# EasyEDA Pro project ProPrj_天猛星电赛扩展板_2026-07-18.epro

# Schematic Schematic1
Board Name: Board1; Create Date: 2026-06-12; Page Name: P1; Project Name: 天猛星电赛扩展板; Schematic Name: Schematic1; Update Date: 2026-07-17; Company: 遇到困难睡大觉zxz; Page Size: A4; Version: V1.0
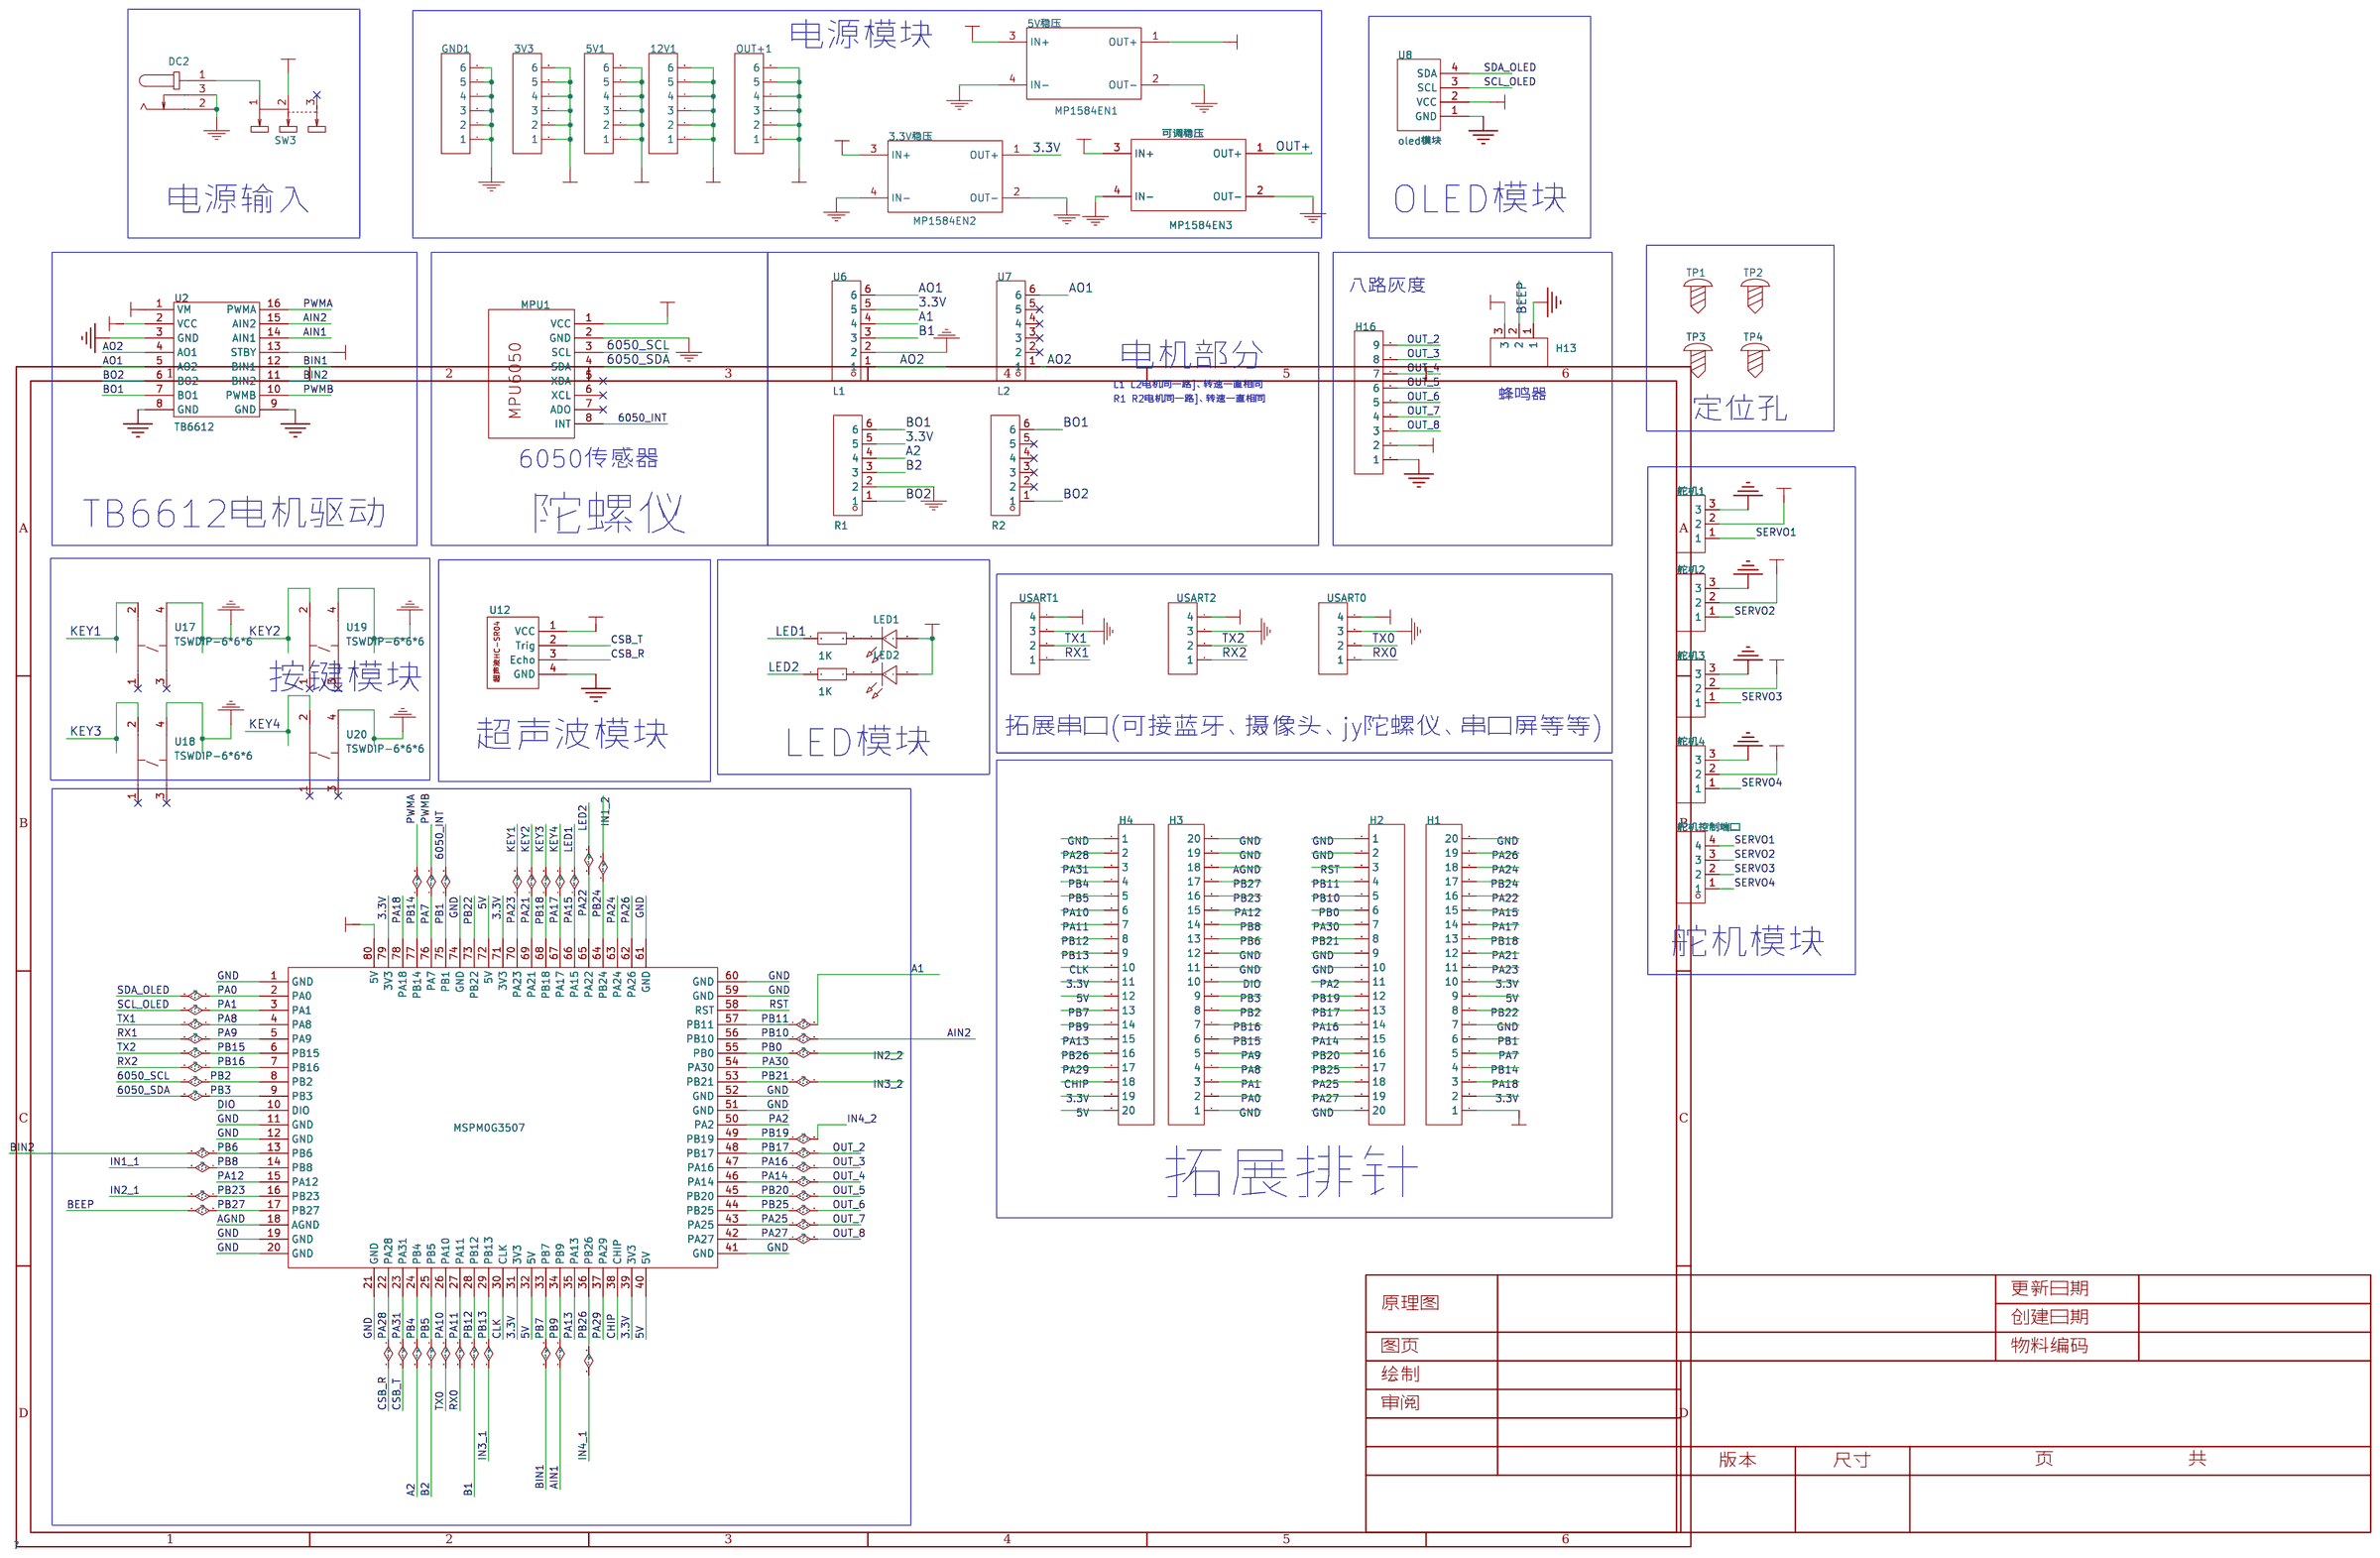
[diagram p0: schematic sheet]

## Parts
3.3V稳压  MP1584EN2  [MP1584EN]
3V3  HDR-M-2.54_1x6  [HDR-M-2.54_1X6]
5V1  HDR-M-2.54_1x6  [HDR-M-2.54_1X6]
5V稳压  MP1584EN1  [MP1584EN]
12V1  HDR-M-2.54_1x6  [HDR-M-2.54_1X6]
DC2  DC005-T  [DC-IN-TH_DC005-T]
GND1  HDR-M-2.54_1x6  [HDR-M-2.54_1X6]
H1  -  [HDR-TH_20P-P2.54-V-F]
H2  -  [HDR-TH_20P-P2.54-V-F]
H3  -  [HDR-TH_20P-P2.54-V-F]
H4  -  [HDR-TH_20P-P2.54-V-F]
H13  -  [HDR-TH_3P-P2.54-V-F]
H16  -  [HDR-TH_9P-P2.54-V-F-1]
LED1  LED-TH-5mm_R  [LED-TH_BD5.0_RED]
LED2  LED-TH-5mm_R  [LED-TH_BD5.0_RED]
MPU1  MPU6050 有孔(锁定丝印)  [MPU6050-丝印不可移]
MSPM0G3507  -  [嘉立创天猛星]
OUT+1  HDR-M-2.54_1x6  [HDR-M-2.54_1X6]
R7  1K  [R_AXIAL-0.3]
R11  1K  [R_AXIAL-0.3]
SW3  SS-12D10L5  [SW-TH_SS-12D10L5]
TP1  M3铜柱带丝印  [M3铜柱]
TP2  M3铜柱带丝印  [M3铜柱]
TP3  M3铜柱带丝印  [M3铜柱]
TP4  M3铜柱带丝印  [M3铜柱]
U2  TB6612  [TB6612模块]
U6  L1  [CONN-TH_6P-P2.50_ZX-XH2.54-6PWZ]
U7  L2  [CONN-TH_6P-P2.50_ZX-XH2.54-6PWZ]
U8  oled模块  [OLED模块]
U9  R2  [CONN-TH_6P-P2.50_ZX-XH2.54-6PWZ]
U12  -  [超声波模块]
U16  R1  [CONN-TH_6P-P2.50_ZX-XH2.54-6PWZ]
U17  TSWDIP-6*6*6  [KEY-TH_4P-L6.0-W6.0-P4.50-LS6.50]
U18  TSWDIP-6*6*6  [KEY-TH_4P-L6.0-W6.0-P4.50-LS6.50]
U19  TSWDIP-6*6*6  [KEY-TH_4P-L6.0-W6.0-P4.50-LS6.50]
U20  TSWDIP-6*6*6  [KEY-TH_4P-L6.0-W6.0-P4.50-LS6.50]
USART0  HDR-M-2.54_1x4  [HDR-M-2.54_1X4]
USART1  HDR-M-2.54_1x4  [HDR-M-2.54_1X4]
USART2  HDR-M-2.54_1x4  [HDR-M-2.54_1X4]
可调稳压  MP1584EN3  [MP1584EN]
舵机1  -  [HDR-TH_3P-P2.54-V-F]
舵机2  -  [HDR-TH_3P-P2.54-V-F]
舵机3  -  [HDR-TH_3P-P2.54-V-F]
舵机4  -  [HDR-TH_3P-P2.54-V-F]
舵机控制端口  -  [HDR-TH_4P-P2.54-V-M]

## Library data of the parts
3.3V稳压 5V稳压 可调稳压 = MP1584EN_DC TO DC成品板: Check: false
3V3 5V1 12V1 GND1 OUT+1 = HDR-M-2.54_1x6: Supplier Part: C190819; Supplier: LCSC; Check: false
DC2 = DC005-T: 连接器类型:DC电源插座;安装方式:弯插;触点内径:2mm;触点外径:6.3mm;额定电流:500mA;额定电压:30V;工作温度范围:-25℃~+70℃;; LCSC Part Name: DC电源插座 内径:2mm 外径:6.3mm; Supplier Part: C431532; Manufacturer: SHOU HAN(首韩); Supplier Footprint: 插件; JLCPCB Part Class: Extended Part; Datasheet: https://atta.szlcsc.com/upload/public/pdf/source/20190925/C431532_27AF2D37554BC0900100E1656035C16A.pdf; Supplier: LCSC; Connector Type: DC电源插座; Mounting Style: 弯插; Inside Contact Diameter: 2mm; Outside Contact Diameter: 6.3mm; Current Rating (Max): 500mA; Voltage Rating (Max): 30V; Operating Temperature Range: -25℃~+70℃; Check: false
H1-H4 = HDR-F_2.54_1x20P: Supplier Part: C50984; Supplier Footprint: 插件; Check: false
H13 舵机1-舵机4 = HDR-F_2.54_1x3P: Supplier Part: C541850; Supplier Footprint: 插件; Check: false
H16 = HDR-F_2.54_1x9P: Supplier Part: C39576; Supplier Footprint: 插件
LED1 LED2 = LED-TH-5mm_R: Manufacturer: EVERLIGHT(台湾亿光); Manufacturer Part: 333-2SURD/S530-A3; Supplier Part: C87271; Supplier: LCSC; Check: false
MPU1 = MPU6050 有孔(锁定丝印): Check: false
MSPM0G3507 = 立创天猛星-MSPM0G3507: Check: false
R7 R11 = Res_0603: Supplier Footprint: 0603; Check: false
SW3 = SS-12D10L5: 电路结构:单刀双掷;安装方式:直插;开关颜色:黑色;额定电流(DC):3A;额定电压(DC):125V;额定电流(AC):3A;额定电压(AC):125V;机械寿命:1万次;; LCSC Part Name: 柄长5mm 直插双档 滑动开关; Supplier Part: C319012; Manufacturer: XKB Connectivity(中国星坤); Supplier Footprint: 插件; JLCPCB Part Class: Extended Part; Datasheet: https://atta.szlcsc.com/upload/public/pdf/source/20211009/D6412F37AABE6F9459A6EE7FA4DAEADB.pdf; Supplier: LCSC; Circuit: 单刀双掷; Actuator Style: 矩形柱状; Pin Style: PC引脚; Switch Length: 13mm; Switch Width: 6.8mm; Switch Height: 6.4mm; Mounting Style: 直插; Actuator Color: 黑色; Current Rating (DC): 3A; Voltage Rating (DC): 125V; Current Rating (AC): 3A; Voltage Rating (AC): 125V; Mechanical Life: 1万次; Operating Temperature: -40℃~+85℃; Check: false
TP1-TP4 = M3铜柱带丝印: Check: false
U2 = TB6612模块: Check: false
U6 U7 U9 U16 = ZX-XH2.54-6PWZ: 插针结构:1x6P;间距:2.5mm;安装方式:弯插;参考系列:XH;总PIN数:6P;排数:1;每排PIN数:6;行距:-;额定电流:3A;触头材质:黄铜;触头镀层:锡;工作温度范围:-25℃~+85℃;; LCSC Part Name: 1x6P 间距:2.5mm 弯插 系列:XH; Supplier Part: C7429645; Manufacturer: Megastar(兆星); Supplier Footprint: 弯插,P=2.5mm; JLCPCB Part Class: 扩展库; Datasheet: https://atta.szlcsc.com/upload/public/pdf/source/20230619/9057EB94260093B1525D11E652DE2D7A.pdf; Supplier: LCSC; Pins Structure: 1x6P; Pitch: 2.5mm; Mounting Type: 弯插; Reference Series: XH; Number of Pins: 6P; Number of Rows: 1; Number of PINs Per Row: 6; Rated Current: 3A; Contact Material: 黄铜; Contact Plating: 锡; Operating Temperature: -25℃~+85℃; Rated Voltage (Max): 250V; Plastic Material: PA66; Flame Retardant Rating: UL94V-0; Color: 白色; Z-Height of the Board: 5.9mm; X-Length of Bottom Edge on Board (Spacing Line): 17.5mm; Y-Width of Bottom Edge on Board: 7.32mm; Check: false
U8 = oled模块: Check: false
U12 = 超声波模块: _: 3; Check: false
U17-U20 = TSWDIP-6*6*6: Supplier Part: C9900020134; JLCPCB Part Class: 扩展库; Supplier: LCSC
USART0-USART2 = HDR-M-2.54_1x4: Supplier Part: C124378; Supplier: LCSC; Check: false
舵机控制端口 = HDR-M_2.54_1x4P: Supplier Part: C492403; Supplier Footprint: 插件; Check: false

## Nets
3.3V: 3.3V稳压.1(OUT+) 3V3.1 3V3.2 3V3.3 3V3.4 3V3.5 3V3.6 H1.2 H1.10 H4.11 H4.19 H13.3 MSPM0G3507.31(3V3) MSPM0G3507.39(3V3) MSPM0G3507.71(3V3) MSPM0G3507.79(3V3) U6.5 U16.5
5V: 5V1.1 5V1.2 5V1.3 5V1.4 5V1.5 5V1.6 5V稳压.1(OUT+) H1.1 H1.9 H4.12 H4.20 H16.2 LED1.1 LED2.1 MPU1.1(VCC) MSPM0G3507.32(5V) MSPM0G3507.40(5V) MSPM0G3507.72(5V) MSPM0G3507.80(5V) U2.2(VCC) U2.13(STBY) U8.2(VCC) U12.1(VCC) USART0.4 USART1.4 USART2.4
AGND: H3.18 MSPM0G3507.18(AGND)
GND: 3.3V稳压.2(OUT-) 3.3V稳压.4(IN-) 5V稳压.2(OUT-) 5V稳压.4(IN-) DC2.2 DC2.3 GND1.1 GND1.2 GND1.3 GND1.4 GND1.5 GND1.6 H1.7 H1.20 H2.1 H2.2 H2.9 H2.10 H2.20 H3.1 H3.11 H3.12 H3.19 H3.20 H4.1 H13.1 H16.1 MPU1.2(GND) MSPM0G3507.1(GND) MSPM0G3507.11(GND) MSPM0G3507.12(GND) MSPM0G3507.19(GND) MSPM0G3507.20(GND) MSPM0G3507.21(GND) MSPM0G3507.41(GND) MSPM0G3507.51(GND) MSPM0G3507.52(GND) MSPM0G3507.59(GND) MSPM0G3507.60(GND) MSPM0G3507.61(GND) MSPM0G3507.74(GND) U2.3(GND) U2.8(GND) U2.9(GND) U6.2 U8.1(GND) U12.4(GND) U16.2 U17.4 U18.4 U19.4 U20.4 USART0.3 USART1.3 USART2.3 可调稳压.2(OUT-) 可调稳压.4(IN-) 舵机1.3 舵机2.3 舵机3.3 舵机4.3
VBAT_IN: 3.3V稳压.3(IN+) 5V稳压.3(IN+) 12V1.1 12V1.2 12V1.3 12V1.4 12V1.5 12V1.6 SW3.2 U2.1(VM) 可调稳压.3(IN+)
6050_INT: H1.6 MPU1.8(INT) MSPM0G3507.75(PB1)
6050_SCL: H3.8 MPU1.3(SCL) MSPM0G3507.8(PB2)
6050_SDA: H3.9 MPU1.4(SDA) MSPM0G3507.9(PB3)
A1: H2.4 MSPM0G3507.57(PB11) U6.4
A2: H4.4 MSPM0G3507.24(PB4) U16.4
AIN1: H4.14 MSPM0G3507.34(PB9) U2.14(AIN1)
AIN2: H2.5 MSPM0G3507.56(PB10) U2.15(AIN2)
AO1: U2.5(AO2) U6.6 U7.6
AO2: U2.4(AO1) U6.1 U7.1
B1: H4.8 MSPM0G3507.28(PB12) U6.3
B2: H4.5 MSPM0G3507.25(PB5) U16.3
BEEP: H3.17 H13.2 MSPM0G3507.17(PB27)
BIN1: H4.13 MSPM0G3507.33(PB7) U2.12(BIN1)
BIN2: H3.13 MSPM0G3507.13(PB6) U2.11(BIN2)
BO1: U2.7(BO1) U9.6 U16.6
BO2: U2.6(BO2) U9.1 U16.1
CHIP: H4.18 MSPM0G3507.38(CHIP)
CLK: H4.10 MSPM0G3507.30(CLK)
CSB_R: H4.2 MSPM0G3507.22(PA28) U12.3(Echo)
CSB_T: H4.3 MSPM0G3507.23(PA31) U12.2(Trig)
DIO: H3.10 MSPM0G3507.10(DIO)
IN1_1: H3.14 MSPM0G3507.14(PB8)
IN1_2: H1.17 MSPM0G3507.64(PB24)
IN2_1: H3.16 MSPM0G3507.16(PB23)
IN2_2: H2.6 MSPM0G3507.55(PB0)
IN3_1: H4.9 MSPM0G3507.29(PB13)
IN3_2: H2.8 MSPM0G3507.53(PB21)
IN4_1: H4.16 MSPM0G3507.36(PB26)
IN4_2: H2.12 MSPM0G3507.49(PB19)
KEY1: H1.11 MSPM0G3507.70(PA23) U17.2
KEY2: H1.12 MSPM0G3507.69(PA21) U19.2
KEY3: H1.13 MSPM0G3507.68(PB18) U18.2
KEY4: H1.14 MSPM0G3507.67(PA17) U20.2
LED1: H1.15 MSPM0G3507.66(PA15) R7.1
LED2: H1.16 MSPM0G3507.65(PA22) R11.1
OUT+: OUT+1.1 OUT+1.2 OUT+1.3 OUT+1.4 OUT+1.5 OUT+1.6 可调稳压.1(OUT+) 舵机1.2 舵机2.2 舵机3.2 舵机4.2
OUT_2: H2.13 H16.9 MSPM0G3507.48(PB17)
OUT_3: H2.14 H16.8 MSPM0G3507.47(PA16)
OUT_4: H2.15 H16.7 MSPM0G3507.46(PA14)
OUT_5: H2.16 H16.6 MSPM0G3507.45(PB20)
OUT_6: H2.17 H16.5 MSPM0G3507.44(PB25)
OUT_7: H2.18 H16.4 MSPM0G3507.43(PA25)
OUT_8: H2.19 H16.3 MSPM0G3507.42(PA27)
PA0: H3.2 MSPM0G3507.2(PA0) U8.4(SDA)
PA1: H3.3 MSPM0G3507.3(PA1) U8.3(SCL)
PA2: H2.11 MSPM0G3507.50(PA2)
PA7: H1.5 MSPM0G3507.76(PA7) U2.10(PWMB)
PA8: H3.4 MSPM0G3507.4(PA8) USART1.2
PA9: H3.5 MSPM0G3507.5(PA9) USART1.1
PA10: H4.6 MSPM0G3507.26(PA10) USART0.2
PA11: H4.7 MSPM0G3507.27(PA11) USART0.1
PA12: H3.15 MSPM0G3507.15(PA12)
PA13: H4.15 MSPM0G3507.35(PA13)
PA18: H1.3 MSPM0G3507.78(PA18)
PA24: H1.18 MSPM0G3507.63(PA24)
PA26: H1.19 MSPM0G3507.62(PA26)
PA29: H4.17 MSPM0G3507.37(PA29)
PA30: H2.7 MSPM0G3507.54(PA30)
PB14: H1.4 MSPM0G3507.77(PB14) U2.16(PWMA)
PB15: H3.6 MSPM0G3507.6(PB15) USART2.2
PB16: H3.7 MSPM0G3507.7(PB16) USART2.1
PB22: H1.8 MSPM0G3507.73(PB22)
RST: H2.3 MSPM0G3507.58(RST)
SERVO1: 舵机1.1 舵机控制端口.4
SERVO2: 舵机2.1 舵机控制端口.3
SERVO3: 舵机3.1 舵机控制端口.2
SERVO4: 舵机4.1 舵机控制端口.1
$1N12722: DC2.1 SW3.1
$1N16587: LED1.2 R7.2
$1N16619: LED2.2 R11.2

Not connected (* = marked no-connect by the designer): MPU1 5(XDA)* 6(XCL)* 7(ADO)*; SW3 3*; U7 2* 3* 4* 5*; U9 2* 3* 4* 5*; U17 1* 3*; U18 1* 3*; U19 1* 3*; U20 1* 3*

## Notes on the sheet
- 电源模块
- 电源输入
- OLED模块
- 八路灰度
- 电机部分
- L1 L2电机同一路]、转速一直相同
- R1 R2电机同一路]、转速一直相同
- 蜂鸣器
- 定位孔
- 6050传感器
- TB6612电机驱动
- 陀螺仪
- 按键模块
- 拓展串口(可接蓝牙、摄像头、jy陀螺仪、串口屏等等)
- 超声波模块
- LED模块
- 舵机模块
- 拓展排针

# Board PCB6
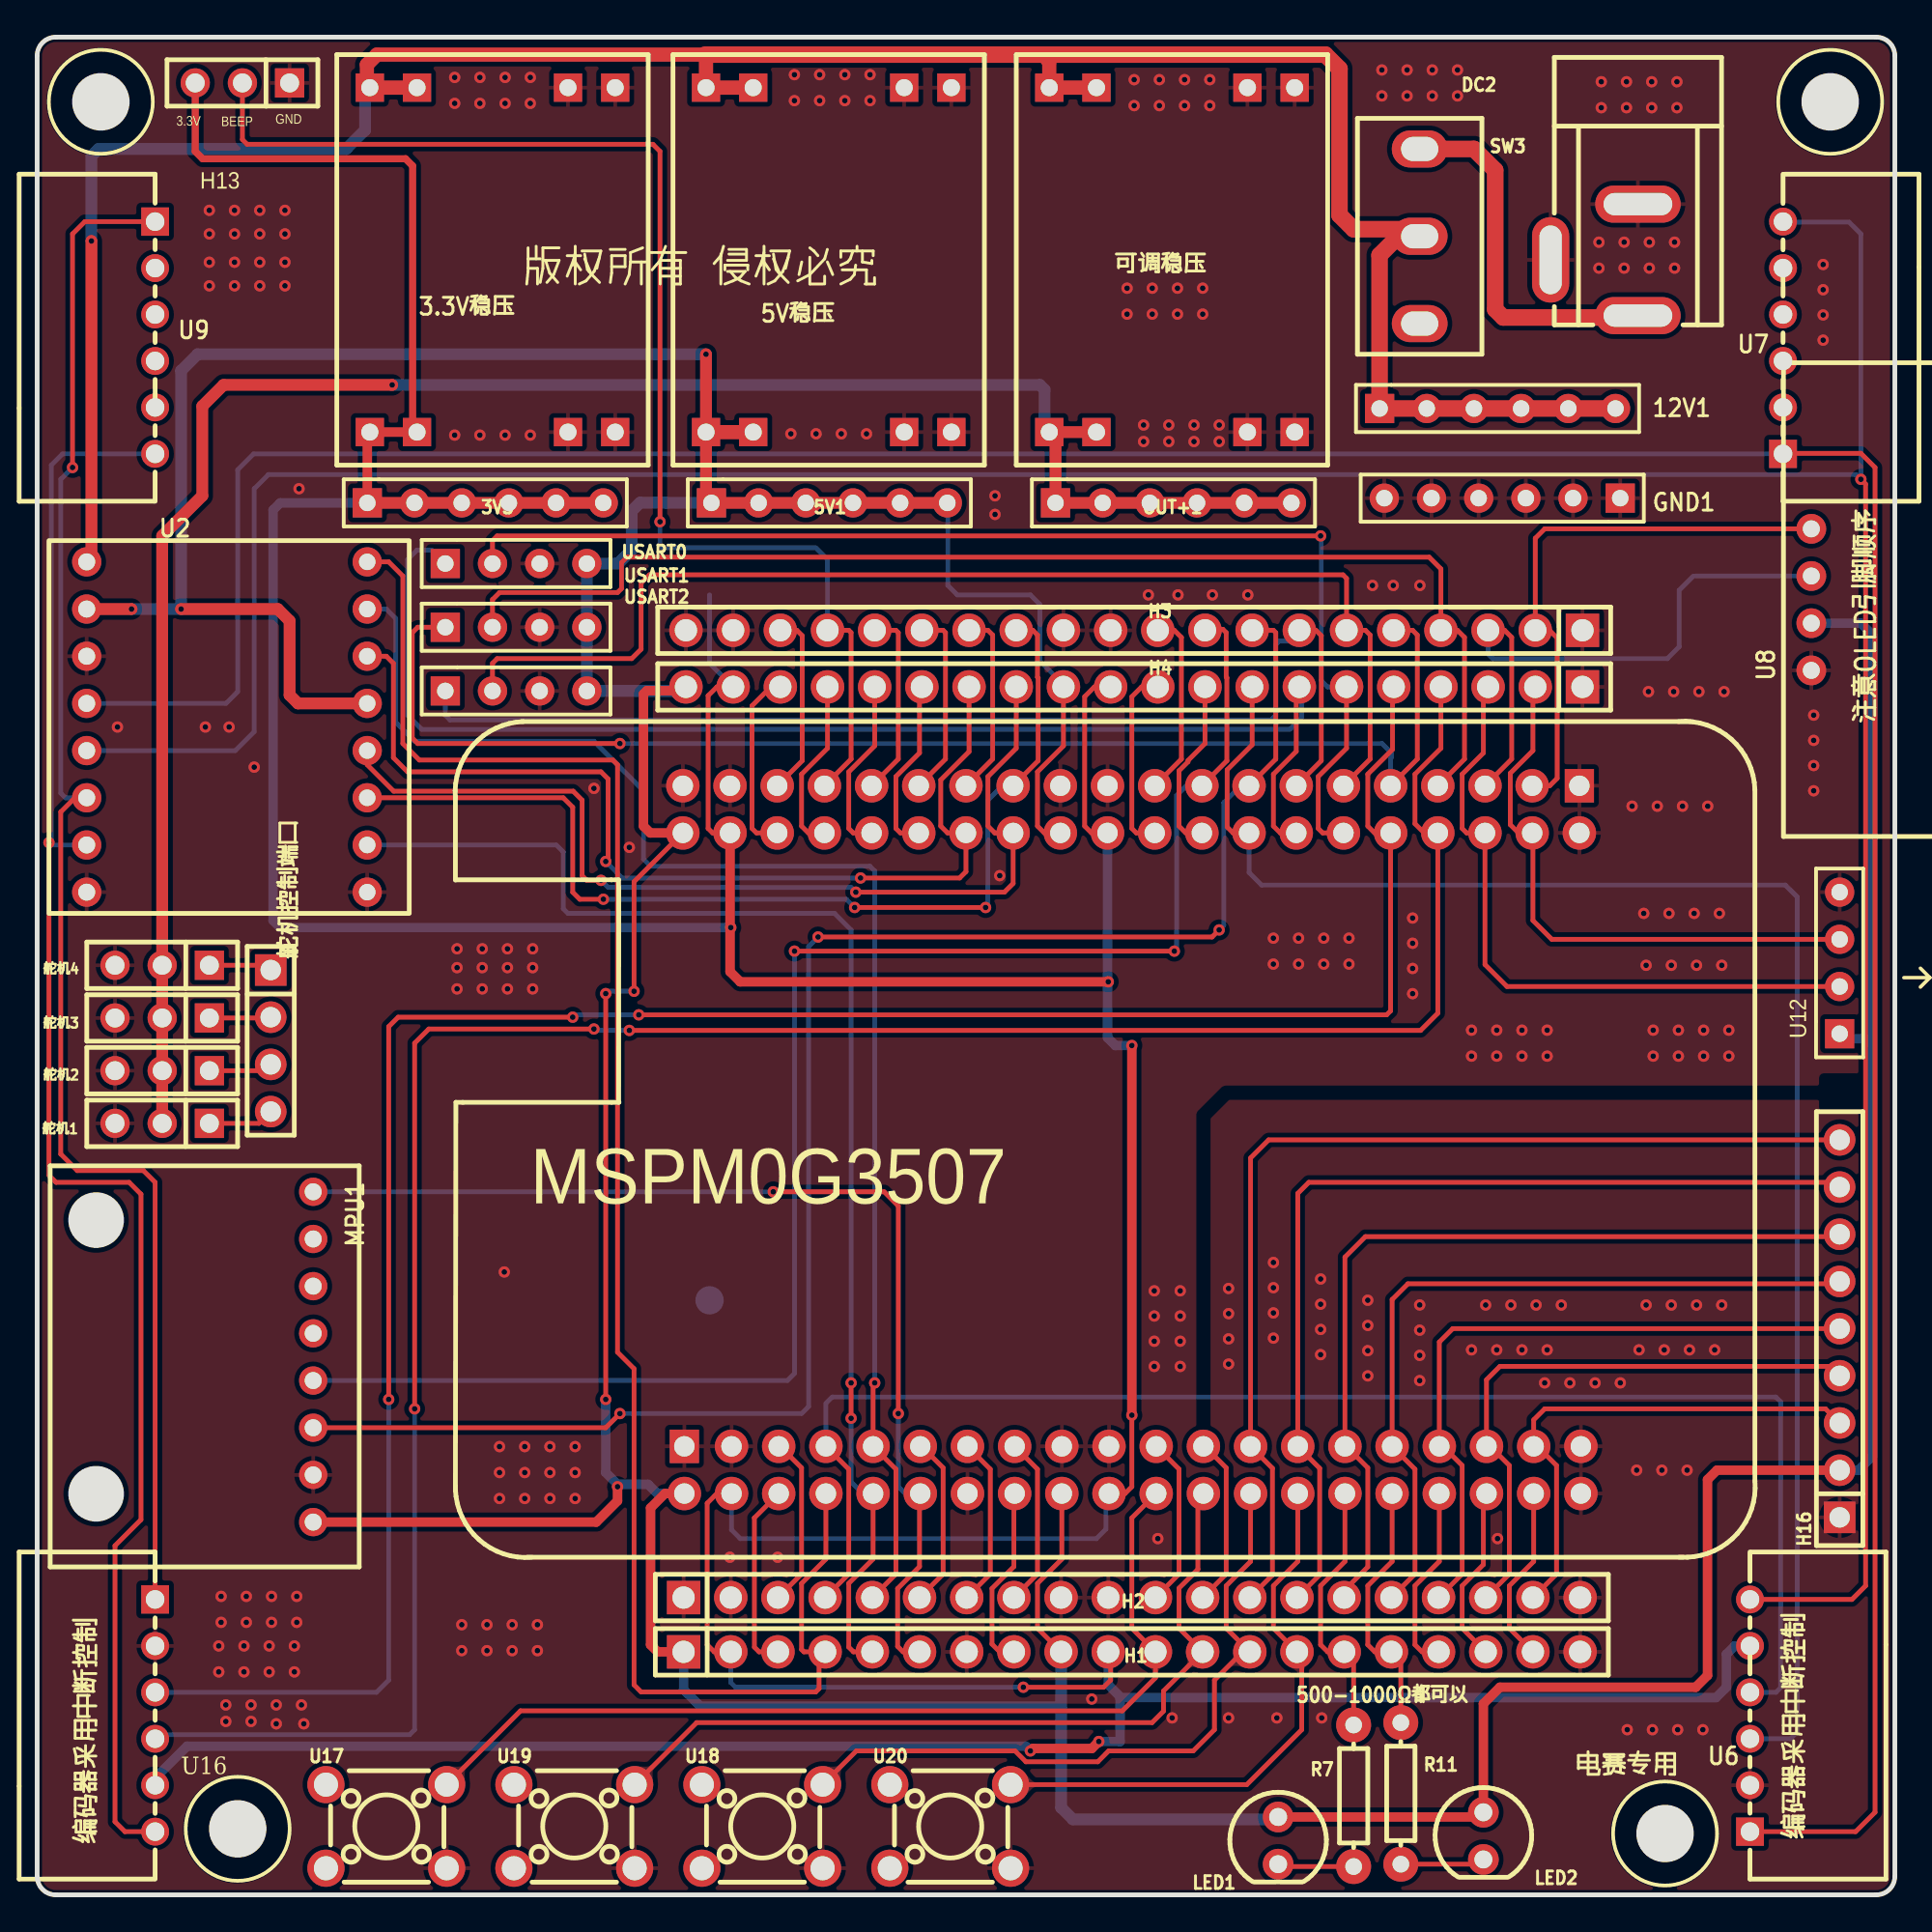
[diagram p1: board, top side]
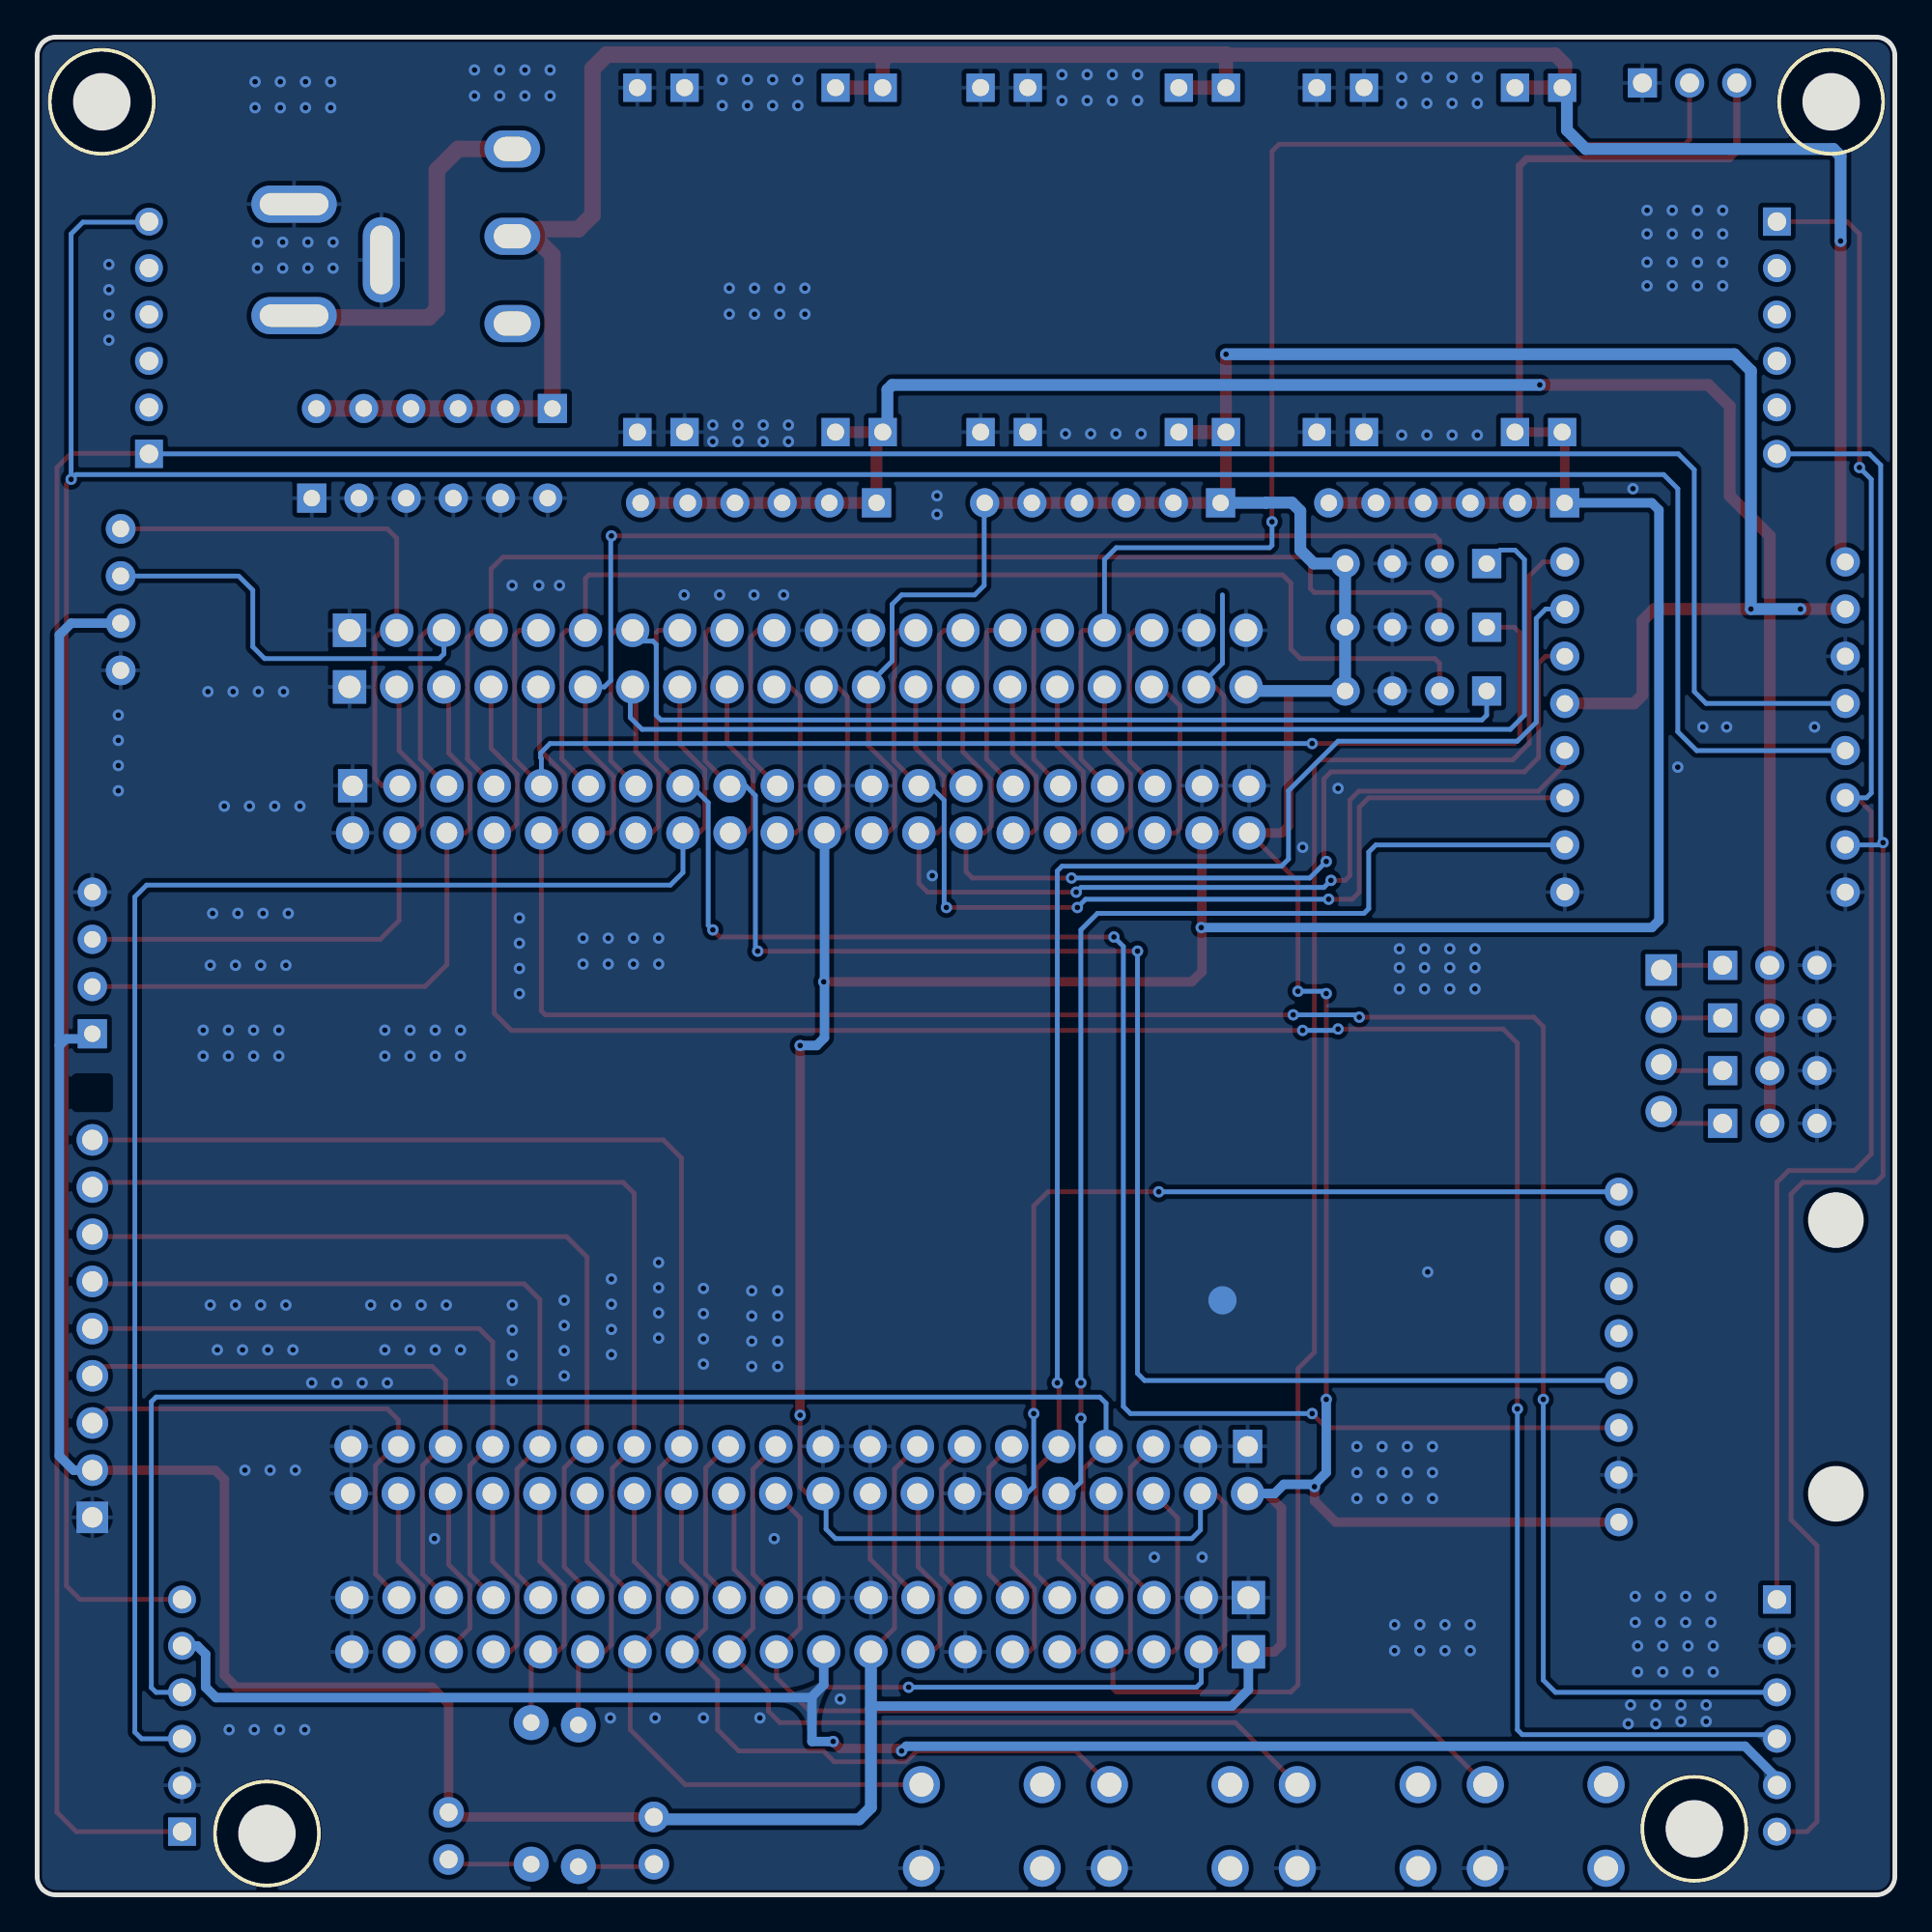
[diagram p2: board, bottom side, seen from below]

Outline 100 x 100 mm; copper layers: Top Layer, Bottom Layer. Coordinates in mm from the lower left corner of the outline.
Outline path: 0,99 0,1 arc(0.29,0.29) 1,0 99,0 arc(99.71,0.29) 100,1 100,99 arc(99.71,99.71) 99,100 1,100 arc(0.29,99.71) 0,99
Stack: Top Layer 0.035mm / Dielectric1 1.51mm FR4 er 4.5 / Bottom Layer 0.035mm

## Design rules (mm)
template: JLCPCB Capability(Two Layers Board)
spacing copperThickness1oz (default): track to track 0.102, other pairs 0.152 to 0.3
spacing copperThickness2oz: track to track 0.203, other pairs 0.152 to 0.3
track width copperThickness1oz (default): min 0.127, default 0.254, max 2.54
track width copperThickness2oz: min 0.203, default 0.254, max 2.54
differential pair differentialPair (default): width min 0.127, default 0.254, max 2.54; gap min 0.152, default 0.152
via viaSize (default): diameter min 0.5, default 0.61, max 10; hole min 0.3, default 0.305, max 6.3

## Placement (name value [footprint] x y rotation side)
3.3V稳压  MP1584EN2  [MP1584EN]  32.89 76.96 180 top
3V3  HDR-M-2.54_1x6  [HDR-M-2.54_1X6]  24.12 74.93 0 top
5V1  HDR-M-2.54_1x6  [HDR-M-2.54_1X6]  42.65 74.93 0 top
5V稳压  MP1584EN1  [MP1584EN]  50.99 76.96 180 top
12V1  HDR-M-2.54_1x6  [HDR-M-2.54_1X6]  78.61 80.01 0 top
DC2  DC005-T  [DC-IN-TH_DC005-T]  83.82 88.01 270 top
GND1  HDR-M-2.54_1x6  [HDR-M-2.54_1X6]  78.87 75.18 180 top
H1  -  [HDR-TH_20P-P2.54-V-F]  58.93 13.08 0 top
H2  -  [HDR-TH_20P-P2.54-V-F]  58.93 16 0 top
H3  -  [HDR-TH_20P-P2.54-V-F]  59.06 68.07 180 top
H4  -  [HDR-TH_20P-P2.54-V-F]  59.06 65.02 180 top
H13  -  [HDR-TH_3P-P2.54-V-F]  11.05 97.54 180 top
H16  -  [HDR-TH_9P-P2.54-V-F-1]  97.03 30.48 90 top
LED1  LED-TH-5mm_R  [LED-TH_BD5.0_RED]  66.8 2.92 0 top
LED2  LED-TH-5mm_R  [LED-TH_BD5.0_RED]  77.85 3.18 0 top
MPU1  MPU6050 有孔(锁定丝印)  [MPU6050-丝印不可移]  14.86 20.07 180 top
MSPM0G3507  -  [嘉立创天猛星]  58.93 40.51 270 top
NOREF  -  [Pad_e19]  36.19 32 0 top
OUT+1  HDR-M-2.54_1x6  [HDR-M-2.54_1X6]  61.17 74.93 0 top
R7  1K  [R_AXIAL-0.3]  70.87 5.33 270 top
R11  1K  [R_AXIAL-0.3]  73.41 5.46 270 top
SW3  SS-12D10L5  [SW-TH_SS-12D10L5]  74.42 89.28 270 top
TP1  M3铜柱带丝印  [M3铜柱]  3.43 96.52 0 top
TP2  M3铜柱带丝印  [M3铜柱]  96.52 96.52 0 top
TP3  M3铜柱带丝印  [M3铜柱]  10.8 3.56 0 top
TP4  M3铜柱带丝印  [M3铜柱]  87.63 3.3 0 top
U2  TB6612  [TB6612模块]  2.67 53.97 0 top
U6  L1  [CONN-TH_6P-P2.50_ZX-XH2.54-6PWZ]  92.2 9.65 90 top
U7  L2  [CONN-TH_6P-P2.50_ZX-XH2.54-6PWZ]  93.98 83.82 90 top
U8  oled模块  [OLED模块]  95.5 69.72 90 top
U9  R2  [CONN-TH_6P-P2.50_ZX-XH2.54-6PWZ]  6.35 83.82 270 top
U12  -  [超声波模块]  98.04 50.17 90 top
U16  R1  [CONN-TH_6P-P2.50_ZX-XH2.54-6PWZ]  6.35 9.65 270 top
U17  TSWDIP-6*6*6  [KEY-TH_4P-L6.0-W6.0-P4.50-LS6.50]  18.8 3.68 0 top
U18  TSWDIP-6*6*6  [KEY-TH_4P-L6.0-W6.0-P4.50-LS6.50]  39.03 3.68 0 top
U19  TSWDIP-6*6*6  [KEY-TH_4P-L6.0-W6.0-P4.50-LS6.50]  28.91 3.68 0 top
U20  TSWDIP-6*6*6  [KEY-TH_4P-L6.0-W6.0-P4.50-LS6.50]  49.15 3.68 0 top
USART0  HDR-M-2.54_1x4  [HDR-M-2.54_1X4]  25.78 71.67 0 top
USART1  HDR-M-2.54_1x4  [HDR-M-2.54_1X4]  25.78 68.24 0 top
USART2  HDR-M-2.54_1x4  [HDR-M-2.54_1X4]  25.78 64.81 0 top
可调稳压  MP1584EN3  [MP1584EN]  69.47 76.96 180 top
舵机1  -  [HDR-TH_3P-P2.54-V-F]  6.73 41.53 180 top
舵机2  -  [HDR-TH_3P-P2.54-V-F]  6.73 44.37 180 top
舵机3  -  [HDR-TH_3P-P2.54-V-F]  6.73 47.2 180 top
舵机4  -  [HDR-TH_3P-P2.54-V-F]  6.73 50.04 180 top
舵机控制端口  -  [HDR-TH_4P-P2.54-V-M]  12.57 45.97 270 top

## Footprints (pads in the part's own frame, mm; a bottom-side part is the same pattern mirrored in y, then rotated)
CONN-TH_6P-P2.50_ZX-XH2.54-6PWZ
  rect 1.524x1.5 hole 1: 1(-6.25,0)
  round 1.5 hole 1: 2(-3.75,0) 3(-1.25,0) 4(1.25,0) 5(3.75,0) 6(6.25,0)
DC-IN-TH_DC005-T
  oval 2x4.6 hole 1.2x3.7: 1(2.999,2.35) 2(-2.999,2.35)
  oval 4.6x2 hole 3.7x1.2: 3(0,-2.35)
HDR-M-2.54_1X4
  rect 1.575x1.575 hole 0.889: 1(-3.81,0)
  round 1.575 hole 0.889: 2(-1.27,0) 3(1.27,0) 4(3.81,0)
HDR-M-2.54_1X6
  rect 1.575x1.575 hole 0.889: 1(-6.35,0)
  round 1.575 hole 0.889: 2(-3.81,0) 3(-1.27,0) 4(1.27,0) 5(3.81,0) 6(6.35,0)
HDR-TH_3P-P2.54-V-F
  rect 1.575x1.575 hole 1.02: 1(-2.54,0)
  round 1.575 hole 1.02: 2(0,0) 3(2.54,0)
HDR-TH_4P-P2.54-V-M
  rect 1.7x1.7 hole 1.1: 1(-3.81,0)
  round 1.7 hole 1.1: 2(-1.27,0) 3(1.27,0) 4(3.81,0)
HDR-TH_9P-P2.54-V-F-1
  rect 1.7x1.7 hole 1.1: 1(-10.16,0)
  round 1.7 hole 1.1: 2(-7.62,0) 3(-5.08,0) 4(-2.54,0) 5(0,0) 6(2.54,0) 7(5.08,0) 8(7.62,0) 9(10.16,0)
HDR-TH_20P-P2.54-V-F
  rect 1.8x1.8 hole 1.2: 1(-24.13,0)
  round 1.8 hole 1.2: 2(-21.59,0) 3(-19.05,0) 4(-16.51,0) 5(-13.97,0) 6(-11.43,0) 7(-8.89,0) 8(-6.35,0) 9(-3.81,0) 10(-1.27,0) 11(1.27,0) 12(3.81,0) 13(6.35,0) 14(8.89,0) 15(11.43,0) 16(13.97,0) 17(16.51,0) 18(19.05,0) 19(21.59,0) 20(24.13,0)
KEY-TH_4P-L6.0-W6.0-P4.50-LS6.50
  round 2 hole 1.3: 1(-3.25,2.25) 2(3.25,2.25) 3(-3.25,-2.25) 4(3.25,-2.25)
LED-TH_BD5.0_RED
  round 1.651 hole 0.965: 1(0,1.27) 2(0,-1.27)
MP1584EN
  rect 1.524x1.524 hole 0.919x0.914: 1(12.446,-1.778) 1(14.986,-1.778) 2(1.778,-1.778) 2(4.318,-1.778) 3(12.446,-20.32) 3(14.986,-20.32) 4(1.778,-20.32) 4(4.318,-20.32)
MPU6050-丝印不可移
  round 1.524 hole 0.914: 1(0,0) 2(0,-2.54) 3(0,-5.08) 4(0,-7.62) 5(0,-10.16) 6(0,-12.7) 7(0,-15.24) 8(0,-17.78)
OLED模块
  round 1.6 hole 0.914: 1(-3.81,0) 2(-1.27,0) 3(1.27,0) 4(3.81,0)
Pad_e19
  round 1.524 smd far side: 1(0,0)
R_AXIAL-0.3
  round 1.879 hole 0.899: 1(-3.81,0) 2(3.81,0)
SW-TH_SS-12D10L5
  oval 2x3 hole 1.3x2: 1(-4.7,0) 2(0,0) 3(4.7,0)
TB6612模块
  round 1.575 hole 0.889x0.914: 1(0,17.78) 2(0,15.24) 3(0,12.7) 4(0,10.16) 5(0,7.62) 6(0,5.08) 7(0,2.54) 8(0,0)
  round 1.575 hole 0.889: 9(15.101,0) 10(15.101,2.54) 11(15.101,5.08) 12(15.101,7.62) 13(15.101,10.16) 14(15.101,12.7) 15(15.101,15.24) 16(15.101,17.78)
嘉立创天猛星
  rect 1.8x1.575 hole 1.1: 1(-19.189,24.09) 60(16.37,-24.09)
  round 1.8 hole 1.1: 2(-19.189,21.549) 3(-19.189,19.009) 4(-19.189,16.47) 5(-19.189,13.93) 6(-19.189,11.389) 7(-19.189,8.85) 8(-19.189,6.309) 9(-19.189,3.769) 10(-19.189,1.23) 11(-19.189,-1.31) 12(-19.189,-3.85) 13(-19.189,-6.391) 14(-19.189,-8.931) 15(-19.189,-11.47) 16(-19.189,-14.011) 17(-19.189,-16.55) 18(-19.189,-19.09) 19(-19.189,-21.631) 20(-19.189,-24.171) 21(-16.649,24.09) 22(-16.649,21.549) 23(-16.649,19.009) 24(-16.649,16.47) 25(-16.649,13.93) 26(-16.649,11.389) 27(-16.649,8.85) 28(-16.649,6.309) 29(-16.649,3.769) 30(-16.649,1.23) 31(-16.649,-1.31) 32(-16.649,-3.85) 33(-16.649,-6.391) 34(-16.649,-8.931) 35(-16.649,-11.47) 36(-16.649,-14.011) 37(-16.649,-16.55) 38(-16.649,-19.09) 39(-16.649,-21.631) 40(-16.649,-24.171) 41(16.37,24.171) 42(16.37,21.631) 43(16.37,19.09) 44(16.37,16.55) 45(16.37,14.011) 46(16.37,11.47) 47(16.37,8.931) 48(16.37,6.391) 49(16.37,3.85) 50(16.37,1.31) 51(16.37,-1.23) 52(16.37,-3.769) 53(16.37,-6.309) 54(16.37,-8.85) 55(16.37,-11.389) 56(16.37,-13.93) 57(16.37,-16.47) 58(16.37,-19.009) 59(16.37,-21.549) 61(18.91,24.171) 62(18.91,21.631) 63(18.91,19.09) 64(18.91,16.55) 65(18.91,14.011) 66(18.91,11.47) 67(18.91,8.931) 68(18.91,6.391) 69(18.91,3.85) 70(18.91,1.31) 71(18.91,-1.23) 72(18.91,-3.769) 73(18.91,-6.309) 74(18.91,-8.85) 75(18.91,-11.389) 76(18.91,-13.93) 77(18.91,-16.47) 78(18.91,-19.009) 79(18.91,-21.549) 80(18.91,-24.09)
超声波模块
  rect 1.575x1.575 hole 0.889: 1(-3.81,1.016)
  round 1.575 hole 0.889: 2(-1.27,1.016) 3(1.27,1.016) 4(3.81,1.016)

## Nets
As in the schematic, except:
GND: 3.3V稳压.2 3.3V稳压.4 5V稳压.2 5V稳压.4 DC2.2 DC2.3 GND1.1 GND1.2 GND1.3 GND1.4 GND1.5 GND1.6 H1.7 H1.20 H2.1 H2.2 H2.9 H2.10 H2.20 H3.1 H3.11 H3.12 H3.19 H3.20 H4.1 H13.1 H16.1 MPU1.2 MSPM0G3507.1 MSPM0G3507.11 MSPM0G3507.12 MSPM0G3507.19 MSPM0G3507.20 MSPM0G3507.21 MSPM0G3507.41 MSPM0G3507.51 MSPM0G3507.52 MSPM0G3507.59 MSPM0G3507.60 MSPM0G3507.61 MSPM0G3507.74 NOREF.1 U2.3 U2.8 U2.9 U6.2 U8.1 U12.4 U16.2 U17.4 U18.4 U19.4 U20.4 USART0.3 USART1.3 USART2.3 可调稳压.2 可调稳压.4 舵机1.3 舵机2.3 舵机3.3 舵机4.3

Pads without a net: MPU1 5 6 7; SW3 3; U7 2 3 4 5; U9 2 3 4 5; U17 1 3; U18 1 3; U19 1 3; U20 1 3

## Via types
v1: diameter 0.61, hole 0.305, Top Layer to Bottom Layer, 323 vias

## Routing (per net, layer and track width the routed paths; a pad name or vN(x,y) marks a point on that pad's centre or on a via; arc(x,y) is an arc through that point)
3.3V: length 345.9
  Top Layer w0.254: H4.11 56.91,65.02 56.39,64.5 56.39,57.53 56.76,57.16 MSPM0G3507.31 ; MSPM0G3507.39 36.36,57.16 36.12,57.4 36.12,64.55 36.59,65.02 H4.19 ; v1(58.93,25.82) 58.93,21.97 58.56,21.6 MSPM0G3507.71 ; v1(53.09,11.18) 57.4,11.18 57.78,11.56 57.78,12.95 H1.10 ; MSPM0G3507.79 36.59,21.6 36.07,21.08 36.07,13.46 36.45,13.08 H1.2
  Top Layer w0.381: H13.3 8.51,93.85 8.91,93.45 19.83,93.45 20.21,93.07 20.21,78.74
  Top Layer w0.508: 3V3.1 17.77,78.61 3.3V稳压.1 20.21,78.74 ; v1(57.15,8.25) 56.77,7.88 53.6,7.88 v1(53.47,7.75) ; MSPM0G3507.39 37.3,49.7 37.85,49.15 v1(57.66,49.15) ; v1(58.93,25.82) v1(58.93,45.72)
  Top Layer w0.635: 3V3.1 3V3.2 3V3.3 3V3.4 3V3.5 3V3.6 ; 3.3V稳压.1 20.21,78.74
  Bottom Layer w0.254: 36.19,69.98 36.19,66.29 H4.19 ; H1.2 37.34,11.43 37.59,11.18 v1(53.09,11.18) ; MSPM0G3507.79 37.38,19.64 37.85,19.18 57.02,19.18 57.53,19.69 57.53,21.44 MSPM0G3507.71
  Bottom Layer w0.508: U16.5 6.35,6.28 8.07,8 53.21,8 v1(53.47,7.75) ; 58.34,10.62 90.37,10.62 90.93,11.18 90.93,12.95 91.38,13.4 U6.5 ; 58.34,10.62 57.66,11.3 H1.10 ; 58.34,10.62 58.29,10.57 58.29,8.25 v1(57.15,8.25) ; MSPM0G3507.31 57.62,46.14 58.04,45.72 v1(58.93,45.72) ; 3V3.1 13.08,74.93 12.7,74.55 12.7,52.45 13.08,52.07 v1(37.34,52.07)
5V: length 364.9
  Top Layer w0.254: MSPM0G3507.72 55.16,18.07 53.85,16.76 53.85,14.35 H1.9 ; H4.12 55.25,61.85 53.85,60.45 53.85,57.53 54.22,57.16 MSPM0G3507.32 ; MSPM0G3507.40 32.13,54.54 v1(32.13,48.64) ; v1(30.61,26.67) v1(30.61,48.51)
  Top Layer w0.508: MPU1.1 30.1,20.07 31.24,21.21 v1(31.24,21.97) ; H4.20 34.72,64.82 32.82,64.82 32.64,64.64 32.64,57.53 33.01,57.16 MSPM0G3507.40 ; LED1.1 77.6,4.19 77.85,4.44 77.85,10.29 78.74,11.18 89.28,11.18 89.92,11.81 89.92,22.35 90.42,22.86 H16.2 ; H1.1 33.4,13.08 33.02,13.46 33.02,20.83 33.79,21.6 MSPM0G3507.80
  Top Layer w0.635: 5V1.6 5V1.5 5V1.4 5V1.3 5V1.2 5V1.1 36,75.22 5V稳压.1 v1(36,82.93) ; v1(7.75,69.22) 12.95,69.22 13.59,68.58 13.59,64.58 14.04,64.14 17.77,64.14 ; 2.67,69.22 v1(5.08,69.22)
  Top Layer w0.762: 5V稳压.1 5V稳压.1
  Bottom Layer w0.254: 5V1.6 49.02,74.9 49.02,70.48 49.53,69.98 53.47,69.98 53.97,69.47 53.97,66.42 55.25,65.15 H4.12 ; v1(30.61,48.51) 30.73,48.64 v1(32.13,48.64)
  Bottom Layer w0.508: 98.81,45.72 98.45,46.08 97.3,46.08 U12.1 ; 98.81,45.72 98.81,23.62 98.04,22.86 H16.2 ; 98.81,45.72 98.81,67.82 98.17,68.45 U8.2 ; H1.1 34.8,11.05 35.69,10.16 55.01,10.16 55.12,10.05 ; MSPM0G3507.80 33.39,21.6 32.89,22.1 31.24,22.1 30.61,22.73 v1(30.61,26.67)
  Bottom Layer w0.635: 5V1.1 33.86,74.93 33.85,74.94 32.45,74.94 32,74.49 32,72.39 31.28,71.67 USART0.4 USART1.4 USART2.4 34.71,64.81 H4.20 ; v1(36,82.93) 8.64,82.93 7.75,82.04 v1(7.75,69.22) v1(5.08,69.22) ; H1.9 55.12,4.7 55.75,4.06 66.68,4.06 LED1.1
AGND: length 9.9
  Top Layer w0.254: MSPM0G3507.18 41.18,61.05 41.18,67.78 40.89,68.07 H3.18
GND:
  vias: v1(4.32,62.86) v1(9.05,62.86) v1(9.27,90.68) v1(9.27,89.41) v1(9.27,87.88) v1(9.27,86.61) v1(9.78,13.4) v1(9.78,12) v1(9.9,16.07) v1(9.9,14.67) v1(10.16,10.22) v1(10.16,9.33) v1(10.33,62.86) v1(10.62,90.68) v1(10.62,89.41) v1(10.62,87.88) v1(10.62,86.61) v1(11.13,13.4) v1(11.13,12) v1(11.26,16.07) v1(11.26,14.67) v1(11.51,10.22) v1(11.51,9.33) v1(11.68,60.71) v1(11.98,90.68) v1(11.98,89.41) v1(11.98,87.88) v1(11.98,86.61) v1(12.49,13.4) v1(12.49,12) v1(12.62,16.07) v1(12.62,14.67) v1(12.87,10.22) v1(12.87,9.21) v1(13.34,90.68) v1(13.34,89.41) v1(13.34,87.88) v1(13.34,86.61) v1(13.85,13.4) v1(13.85,12) v1(13.97,16.07) v1(13.97,14.67) v1(14.1,75.69) v1(14.23,10.22) v1(14.35,9.21) v1(22.48,97.83) v1(22.48,96.44) v1(22.48,78.58) v1(22.6,50.93) v1(22.6,49.91) v1(22.6,48.77) v1(22.86,14.54) v1(22.86,13.14) v1(23.83,97.83) v1(23.83,96.44) v1(23.83,78.58) v1(23.96,50.93) v1(23.96,49.91) v1(23.96,48.77) v1(24.21,14.54) v1(24.21,13.14) v1(24.89,24.13) v1(24.89,22.73) v1(24.89,21.34) v1(25.15,33.53) v1(25.19,97.83) v1(25.19,96.44) v1(25.19,78.58) v1(25.32,50.93) v1(25.32,49.91) v1(25.32,48.77) v1(25.57,14.54) v1(25.57,13.14) v1(26.25,24.13) v1(26.25,22.73) v1(26.25,21.34) v1(26.55,97.83) v1(26.55,96.44) v1(26.55,78.58) v1(26.67,50.93) v1(26.67,49.91) v1(26.67,48.77) v1(26.93,14.54) v1(26.93,13.14) v1(27.6,24.13) v1(27.6,22.73) v1(27.6,21.34) v1(28.96,24.13) v1(28.96,22.73) v1(28.96,21.34) v1(29.97,59.56) v1(31.88,56.39) v1(37.29,18.17) v1(39.86,18.17) v1(40.57,78.65) v1(40.76,97.98) v1(40.76,96.58) v1(41.93,78.65) v1(42.12,97.98) v1(42.12,96.58) v1(43.29,78.65) v1(43.48,97.98) v1(43.48,96.58) v1(44.64,78.65) v1(44.83,97.98) v1(44.83,96.58) v1(51.56,75.31) v1(51.56,74.31) v1(51.82,54.86) v1(56.77,10.54) v1(58.67,86.49) v1(58.67,85.09) v1(59.05,97.71) v1(59.05,96.31) v1(59.56,79.12) v1(59.56,78.23) v1(59.82,69.98) v1(60.03,86.49) v1(60.03,85.09) v1(60.13,32.52) v1(60.13,31.16) v1(60.13,29.8) v1(60.13,28.44) v1(60.32,19.18) v1(60.41,97.71) v1(60.41,96.31) v1(60.92,79.12) v1(60.92,78.23) v1(61.1,9.53) v1(61.38,86.49) v1(61.38,85.09) v1(61.41,69.98) v1(61.53,32.52) v1(61.53,31.16) v1(61.53,29.8) v1(61.53,28.44) v1(61.77,97.71) v1(61.77,96.31) v1(62.27,79.12) v1(62.27,78.23) v1(62.74,86.49) v1(62.74,85.09) v1(63.12,97.71) v1(63.12,96.31) v1(63.26,69.98) v1(63.63,79.12) v1(63.63,78.23) v1(64.13,32.64) v1(64.13,31.29) v1(64.13,29.93) v1(64.13,28.57) v1(64.13,9.53) v1(65.17,69.98) v1(66.54,51.5) v1(66.54,50.1) v1(66.55,34.04) v1(66.55,32.68) v1(66.55,31.33) v1(66.55,29.97) v1(66.73,9.53) v1(67.9,51.5) v1(67.9,50.1) v1(69.09,33.15) v1(69.09,31.79) v1(69.09,30.44) v1(69.09,29.08) v1(69.15,9.53) v1(69.26,51.5) v1(69.26,50.1) v1(70.62,51.5) v1(70.62,50.1) v1(71.63,32.01) v1(71.63,30.65) v1(71.63,29.29) v1(71.63,27.94) v1(71.88,70.48) v1(72.39,98.23) v1(72.39,96.84) v1(73,70.48) v1(73.74,98.23) v1(73.74,96.84) v1(74.04,52.58) v1(74.04,51.22) v1(74.04,49.87) v1(74.04,48.51) v1(74.43,70.48) v1(74.42,31.75) v1(74.42,30.4) v1(74.42,29.04) v1(74.42,27.68) v1(75.1,98.23) v1(75.1,96.84) v1(76.46,98.23) v1(76.46,96.84) v1(77.21,46.55) v1(77.21,45.15) v1(77.21,29.34) v1(77.97,31.75) v1(78.57,46.55) v1(78.57,45.15) v1(78.57,29.34) v1(78.61,19.18) v1(79.33,31.75) v1(79.93,46.55) v1(79.93,45.15) v1(79.93,29.34) v1(80.69,31.75) v1(81.15,27.56) v1(81.28,46.55) v1(81.28,45.15) v1(81.28,29.34) v1(82.05,31.75) v1(82.51,27.56) v1(83.86,27.56) v1(84.07,88.96) v1(84.07,87.57) v1(84.2,97.6) v1(84.2,96.2) v1(85.22,27.56) v1(85.43,88.96) v1(85.43,87.57) v1(85.55,97.6) v1(85.55,96.2) v1(85.59,8.89) v1(85.86,58.6) v1(86.1,22.86) v1(86.23,29.34) v1(86.48,52.83) v1(86.61,50.04) v1(86.61,31.75) v1(86.74,64.77) v1(86.78,88.96) v1(86.78,87.57) v1(86.91,97.6) v1(86.91,96.2) v1(86.99,46.55) v1(86.99,45.15) v1(86.95,8.89) v1(87.21,58.6) v1(87.46,22.86) v1(87.59,29.34) v1(87.84,52.83) v1(87.97,50.04) v1(87.97,31.75) v1(88.14,88.96) v1(88.14,87.57) v1(88.09,64.77) v1(88.27,97.6) v1(88.27,96.2) v1(88.35,46.55) v1(88.35,45.15) v1(88.31,8.89) v1(88.57,58.6) v1(88.82,22.86) v1(88.94,29.34) v1(89.2,52.83) v1(89.32,50.04) v1(89.32,31.75) v1(89.45,64.77) v1(89.71,46.55) v1(89.71,45.15) v1(89.67,8.89) v1(89.93,58.6) v1(90.3,29.34) v1(90.55,52.83) v1(90.68,50.04) v1(90.68,31.75) v1(90.81,64.77) v1(91.06,46.55) v1(91.06,45.15) v1(95.63,63.5) v1(95.63,62.15) v1(95.63,60.79) v1(95.63,59.43) v1(96.14,87.76) v1(96.14,86.4) v1(96.14,85.05) v1(96.14,83.69)
VBAT_IN: length 141
  Top Layer w0.635: U2.1 2.92,72.01 v1(2.92,89.03)
  Top Layer w0.762: 5V稳压.3 5V稳压.3 36,99.02 35.96,99.06 18.29,99.06 17.75,98.52 17.75,97.44 3.3V稳压.3 3.3V稳压.3 ; 可调稳压.3 可调稳压.3 54.48,98.68 54.36,98.81
  Top Layer w0.889: 35.96,99.06 69.34,99.06 70.1,98.3 70.1,90.42 70.87,89.66 74.04,89.66 SW3.2 73.28,89.28 72.26,88.27 12V1.1 12V1.2 12V1.3 12V1.4 12V1.5 12V1.6
  Bottom Layer w0.635: 3.3V稳压.3 17.65,97.03 17.65,95 16.64,93.98 3.3,93.98 2.92,93.6 v1(2.92,89.03)
6050_INT: length 58.3
  Top Layer w0.254: v1(46.35,25.91) 46.35,37.08 45.59,37.85 v1(39.62,37.85) ; H1.6 46.61,13.08 46.32,13.37 46.32,16.49 47.5,17.67 47.5,21.56 MSPM0G3507.75
  Bottom Layer w0.254: v1(46.35,25.91) 46.35,21.97 46.72,21.6 MSPM0G3507.75 ; MPU1.8 v1(39.62,37.85)
6050_SCL: length 93.2
  Top Layer w0.254: v1(42.04,51.56) 63.25,51.56 v1(63.63,51.94) ; MSPM0G3507.8 66.68,61.14 66.68,67.94 66.55,68.07 H3.8 ; MPU1.3 30.61,25.15 v1(31.37,25.91)
  Bottom Layer w0.254: v1(42.04,51.56) 41.53,51.05 41.53,26.29 41.15,25.91 v1(31.37,25.91) ; MSPM0G3507.8 64.78,59.7 63.88,58.8 63.88,52.19 v1(63.63,51.94)
6050_SDA: length 89.3
  Top Layer w0.254: MSPM0G3507.9 64.04,61.05 64.04,65.51 64.01,65.55 64.01,67.94 63.83,68.12 62.92,68.12 H3.9 ; v1(40.77,50.8) v1(61.21,50.8)
  Bottom Layer w0.254: MPU1.4 40.39,27.69 40.77,28.07 v1(40.77,50.8) ; v1(61.21,50.8) 61.34,50.92 61.34,59.18 61.86,59.7 MSPM0G3507.9
A1: length 80.3
  Top Layer w0.254: MSPM0G3507.57 43.69,22.91 43.69,17.27 H2.4
  Bottom Layer w0.254: U6.4 93.6,10.9 93.85,11.16 93.85,26.54 93.6,26.8 42.8,26.8 42.46,26.46 MSPM0G3507.57
A2: length 126
  Top Layer w0.254: v1(29.97,46.61) 21.08,46.61 20.32,45.85 v1(20.32,26.16) ; v1(31.88,46.53) 74.47,46.53 75.4,47.46 MSPM0G3507.24 74.66,57.16 74.17,57.66 74.17,60.33 75.56,61.72 H4.4
  Bottom Layer w0.254: v1(29.97,46.61) 30.05,46.53 v1(31.88,46.53) ; v1(20.32,26.16) 20.32,8.89 20.05,8.62 6.57,8.62 U16.4
AIN1: length 54.8
  Top Layer w0.254: U2.14 18.8,66.67 19.18,66.29 19.18,61.21 19.94,60.45 30.35,60.45 30.73,60.07 30.73,55.75 v1(30.61,55.63) ; 50.16,65.02 50.16,61.54 48.64,60.01 48.64,57.53 49.01,57.16 MSPM0G3507.34 50,55.08 49.66,54.74 v1(44.32,54.74)
  Bottom Layer w0.254: v1(30.61,55.63) 31.5,54.74 v1(44.32,54.74)
AIN2: length 78.8
  Top Layer w0.254: H2.5 46.23,17.27 46.23,22.91 MSPM0G3507.56 45,27.47 v1(45.09,27.56)
  Bottom Layer w0.254: v1(45.09,27.56) 45.09,55.12 44.83,55.37 33.02,55.37 32.64,55.75 32.64,59.44 29.97,62.1 20.32,62.1 19.3,63.12 19.3,68.71 18.8,69.22 17.77,69.22
AO1: length 193.3
  Top Layer w0.254: v1(98.17,76.2) 98.43,75.95 98.43,16.64 97.69,15.9 U6.6
  Bottom Layer w0.254: U2.5 10.67,61.59 11.68,62.61 11.68,75.69 12.45,76.45 97.92,76.45 v1(98.17,76.2) 98.17,89.41 97.54,90.04 94.01,90.04 U7.6
AO2: length 188.7
  Top Layer w0.254: U6.1 97.89,3.4 98.93,4.44 98.93,76.83 98.17,77.6 94.01,77.6 U7.1
  Bottom Layer w0.254: 2.67,64.14 10.16,64.14 10.8,64.77 10.8,76.71 11.66,77.57 U7.1
B1: length 89.2
  Top Layer w0.254: H4.8 65.41,61.91 64.06,60.56 64.06,57.48 64.38,57.16 MSPM0G3507.28
  Bottom Layer w0.254: MSPM0G3507.28 65.24,55.03 65.91,54.36 94.11,54.36 94.74,53.72 94.74,8.76 94.38,8.4 U6.3
B2: length 121.3
  Top Layer w0.254: v1(28.83,47.24) 19.43,47.24 18.92,46.74 v1(18.92,26.67) ; v1(32.38,47.37) 72.64,47.37 72.86,47.58 MSPM0G3507.25 72,57.16 71.63,57.53 71.63,60.33 72.96,61.66 72.96,64.96 H4.5
  Bottom Layer w0.254: v1(28.83,47.24) 28.96,47.37 v1(32.38,47.37) ; v1(18.92,26.67) 18.92,11.56 18.27,10.9 U16.3
BEEP: length 70.3
  Top Layer w0.254: MSPM0G3507.17 43.81,61.14 43.81,67.94 43.69,68.07 42.54,68.07 ; v1(33.53,73.91) 33.53,93.85 33.15,94.23 11.3,94.23 11.05,94.49 H13.2
  Bottom Layer w0.254: 42.54,68.07 42.54,71.88 41.91,72.52 33.66,72.52 33.53,72.64 v1(33.53,73.91)
BIN1: length 53.3
  Top Layer w0.254: H4.13 52.71,61.72 51.18,60.2 51.18,57.53 51.55,57.16 MSPM0G3507.33 52.54,54.44 52.07,53.97 v1(44.07,53.97) ; v1(30.35,54.61) 29.59,54.61 29.34,54.86 29.34,58.93 28.85,59.41 19.19,59.41 17.77,60.83 U2.12
  Bottom Layer w0.254: v1(30.35,54.61) 30.73,54.23 43.81,54.23 v1(44.07,53.97)
BIN2: length 55.9
  Top Layer w0.254: v1(44.01,53.15) v1(51.05,53.15) ; v1(30.48,53.59) 29.21,53.59 28.83,53.97 28.83,58.55 28.32,59.06 17.77,59.06 ; H3.13 53.59,68.07 53.85,67.82 53.85,65.55 53.88,65.51 53.88,61.05 MSPM0G3507.13
  Bottom Layer w0.254: MSPM0G3507.13 51.96,59.7 51.18,58.92 51.18,53.27 v1(51.05,53.15) ; v1(30.48,53.59) 43.56,53.59 v1(44.01,53.15)
BO1: length 88.2
  Top Layer w0.254: U16.6 4.73,3.4 4.19,3.94 4.19,18.8 5.59,20.19 5.59,37.72 4.95,38.35 1.02,38.35 0.64,38.73 v1(0.64,56.64)
  Bottom Layer w0.254: U2.7 0.76,56.52 0.76,76.96 1.37,77.57 U9.6
BO2: length 84.9
  Top Layer w0.254: 2.67,59.06 2.03,59.06 1.27,58.29 1.27,39.88 2.16,38.99 5.72,38.99 6.35,38.35 U16.1 ; v1(1.91,76.83) 1.91,89.41 2.57,90.07 U9.1
  Bottom Layer w0.254: v1(1.91,76.83) 1.27,76.2 1.27,59.31 1.52,59.06 2.67,59.06
CHIP: length 10
  Top Layer w0.254: H4.18 39.5,65.02 38.48,64.01 38.48,57.4 38.72,57.16 MSPM0G3507.38
CLK: length 10
  Top Layer w0.254: MSPM0G3507.30 59.17,57.16 58.93,57.4 58.93,64.5 59.45,65.02 60.32,65.02
CSB_R: length 31
  Top Layer w0.254: H4.2 80.52,64.9 80.52,61.59 79.3,60.38 79.3,57.61 79.74,57.16 MSPM0G3507.22 80.52,57.12 80.52,52.45 81.53,51.44 U12.3
CSB_T: length 36.2
  Top Layer w0.254: 78.1,65.02 77.85,64.77 77.85,61.47 76.71,60.33 76.71,57.4 76.95,57.16 MSPM0G3507.23 77.94,50.08 79.12,48.89 U12.2
DIO: length 10
  Top Layer w0.254: MSPM0G3507.10 61.59,61.14 61.59,67.69 61.21,68.07 60.32,68.07
IN1_1: length 10.1
  Top Layer w0.254: 50.16,68.07 51.18,68.07 51.44,67.82 51.44,61.14 MSPM0G3507.14
IN1_2: length 10.1
  Top Layer w0.254: H1.17 74.55,13.08 74.17,13.46 74.17,16.64 75.48,17.95 MSPM0G3507.64
IN2_1: length 10.2
  Top Layer w0.254: H3.16 46.23,68.07 46.35,67.94 46.35,61.14 MSPM0G3507.16
IN2_2: length 9.2
  Top Layer w0.254: MSPM0G3507.55 47.61,24.14 48.77,22.99 48.77,17.27 H2.6
IN3_1: length 9.5
  Top Layer w0.254: MSPM0G3507.29 61.84,57.16 61.47,57.53 61.47,60.51 61.95,60.99 61.95,61.06 62.87,61.98 H4.9
IN3_2: length 9.2
  Top Layer w0.254: H2.8 53.85,17.27 53.85,22.91 MSPM0G3507.53
IN4_1: length 9.5
  Top Layer w0.254: H4.16 45.09,61.85 43.69,60.45 43.69,57.4 43.93,57.16 MSPM0G3507.36
IN4_2: length 9.2
  Top Layer w0.254: MSPM0G3507.49 62.85,24.14 64.01,22.99 64.01,17.27 H2.12
KEY1: length 51.5
  Top Layer w0.254: U17.2 26.02,9.91 58.42,9.91 60.2,11.68 H1.11 58.93,14.35 58.93,20.29 MSPM0G3507.70
KEY2: length 43.8
  Top Layer w0.254: MSPM0G3507.69 62.48,21.31 62.48,17.53 61.47,16.51 61.47,14.35 H1.12 60.63,10.97 60.63,9.89 60.02,9.27 35.5,9.27 U19.2
KEY3: length 37.6
  Top Layer w0.254: U18.2 44.1,7.75 52.64,7.75 53.22,7.16 57.09,7.16 57.68,7.75 62.23,7.75 63.37,8.89 63.37,11.56 64.9,13.08 H1.13 64.01,14.35 64.01,16.64 65.32,17.95 MSPM0G3507.68
KEY4: length 30.8
  Top Layer w0.254: U20.2 65.12,5.93 68.07,8.89 68.07,12.83 H1.14 66.55,14.35 66.55,16.64 67.86,17.95 MSPM0G3507.67
LED1: length 14.3
  Top Layer w0.254: MSPM0G3507.66 70.4,17.95 69.09,16.64 69.09,13.46 69.47,13.08 H1.15 70.87,12.57 R7.1
LED2: length 14.1
  Top Layer w0.254: R11.1 73.41,12.57 H1.16 72.01,13.08 71.63,13.46 71.63,16.64 72.94,17.95 MSPM0G3507.65
OUT+: length 107
  Top Layer w0.635: OUT+1.6 OUT+1.5 OUT+1.4 OUT+1.3 OUT+1.2 OUT+1.1 54.82,78.41 可调稳压.1 可调稳压.1 ; v1(19.11,81.28) 10.03,81.28 8.89,80.14 8.89,75.31 6.73,73.15 舵机4.2 舵机3.2 舵机2.2 舵机1.2
  Bottom Layer w0.635: 可调稳压.1 54.23,78.99 54.23,81.03 53.97,81.28 v1(19.11,81.28)
OUT_2: length 56.8
  Top Layer w0.254: H16.9 66.29,40.64 65.32,39.66 MSPM0G3507.48 66.5,22.96 66.5,17.22 H2.13
OUT_3: length 52.3
  Top Layer w0.254: H16.8 96.77,38.35 68.45,38.35 67.86,37.76 MSPM0G3507.47 69.04,22.96 69.04,17.22 H2.14
OUT_4: length 46.5
  Top Layer w0.254: H16.7 96.9,35.43 71.5,35.43 70.4,34.33 MSPM0G3507.46 70.47,24.14 71.63,22.99 71.63,17.65 70.36,16.38 H2.15
OUT_5: length 41.6
  Top Layer w0.254: H16.6 96.9,32.89 73.79,32.89 72.94,32.04 MSPM0G3507.45 74.17,22.91 74.17,17.27 H2.16
OUT_6: length 36.8
  Top Layer w0.254: H2.17 76.71,17.27 76.71,23.11 75.68,24.14 MSPM0G3507.44 75.48,29.76 76.2,30.48 H16.5
OUT_7: length 32.4
  Top Layer w0.254: H16.4 96.52,28.45 78.74,28.45 78.02,27.73 MSPM0G3507.43 78.22,24.14 79.25,23.11 79.25,17.27 H2.18
OUT_8: length 27.7
  Top Layer w0.254: H2.19 81.79,17.27 81.79,23.11 80.76,24.14 MSPM0G3507.42 80.56,25.57 81.15,26.16 96.27,26.16 H16.3
PA0: length 30.4
  Top Layer w0.254: MSPM0G3507.2 81.42,59.7 81.82,60.11 81.82,67.66 81.41,68.07 H3.2 80.65,73.03 81.15,73.53 U8.4
PA1: length 32.3
  Top Layer w0.254: MSPM0G3507.3 79.38,61.14 79.38,67.69 78.99,68.07 78.1,68.07
  Bottom Layer w0.254: 89.15,70.99 88.39,70.23 88.39,67.18 87.76,66.55 78.36,66.55 78.1,66.8 78.1,68.07 ; U8.3 89.28,70.99
PA2: length 9.2
  Top Layer w0.254: H2.11 61.47,17.27 61.47,22.91 MSPM0G3507.50
PA7: length 71.1
  Top Layer w0.254: H1.5 43.94,13.08 43.69,13.34 43.69,16.77 45,18.08 MSPM0G3507.76 ; v1(43.81,27.56) v1(43.81,25.65)
  Bottom Layer w0.254: v1(43.81,27.56) 43.81,51.94 42.93,52.83 28.57,52.83 28.32,53.09 28.32,56.13 27.94,56.52 U2.10 ; MSPM0G3507.76 44.44,21.6 43.81,22.22 v1(43.81,25.65)
PA8: length 67.9
  Top Layer w0.254: USART1.2 24.51,69.72 24.89,70.1 31.24,70.1 31.46,70.32 31.46,71.72 31.75,72.01 74.93,72.01 75.56,71.37 H3.4 76.45,68.07 76.84,67.69 76.84,61.14 MSPM0G3507.4
PA9: length 72.5
  Top Layer w0.254: v1(31.37,61.98) 20.48,61.98 20.19,62.27 20.19,67.94 20.48,68.24 USART1.1 ; H3.5 74.04,68.07 74.29,67.82 74.29,61.14 MSPM0G3507.5
  Bottom Layer w0.254: MSPM0G3507.5 72.86,61.17 72.9,61.21 72.9,61.47 72.39,61.98 v1(31.37,61.98)
PA10: length 64.9
  Top Layer w0.254: H4.6 70.49,61.72 68.96,60.2 68.96,57.4 69.2,57.16 MSPM0G3507.26 ; v1(69.09,73.15) 24.77,73.15 24.51,72.9 USART0.2
  Bottom Layer w0.254: v1(69.09,73.15) 69.12,73.12 69.12,65.37 69.47,65.02 H4.6
PA11: length 70.8
  Top Layer w0.254: MSPM0G3507.27 66.92,57.16 66.55,57.53 66.55,60.33 67.78,61.55 67.78,64.86 H4.7
  Bottom Layer w0.254: H4.7 68.07,64.9 68.07,63.37 67.44,62.74 20.7,62.74 19.94,63.5 19.94,71.88 20.45,72.39 21.25,72.39 USART0.1
PA12: length 10.2
  Top Layer w0.254: H3.15 48.77,68.07 48.9,67.94 48.9,61.14 MSPM0G3507.15
PA13: length 9.5
  Top Layer w0.254: H4.15 47.5,64.9 47.5,61.47 46.23,60.2 46.23,57.4 46.47,57.16 MSPM0G3507.35
PA18: length 10.2
  Top Layer w0.254: MSPM0G3507.78 38.61,20.29 38.61,13.34 38.86,13.08 H1.3
PA24: length 9.6
  Top Layer w0.254: MSPM0G3507.63 77.85,21.44 77.85,17.78 76.71,16.64 76.71,14.35 H1.18
PA26: length 9.6
  Top Layer w0.254: H1.19 79.25,14.35 79.25,16.64 80.56,17.95 MSPM0G3507.62
PA29: length 9.5
  Top Layer w0.254: 42.54,65.02 42.54,61.72 41.15,60.33 41.15,57.53 41.52,57.16 MSPM0G3507.37
PA30: length 9.2
  Top Layer w0.254: H2.7 51.31,17.27 51.31,22.91 MSPM0G3507.54
PB14: length 95.7
  Top Layer w0.254: MSPM0G3507.77 42.46,18.07 41.15,16.76 41.15,13.21 41.28,13.08 H1.4 42.09,12.75 42.09,11.1 41.91,10.92 32.51,10.92 32.13,11.3 32.13,28.32 31.24,29.21 31.24,60.83 30.99,61.09 20.57,61.09 19.69,61.98 19.69,70.99 18.92,71.75 U2.16
PB15: length 64.5
  Top Layer w0.254: MSPM0G3507.6 71.75,61.14 71.75,67.82 71.5,68.07 H3.6 70.49,70.87 70.29,71.06 32.96,71.06 32.51,70.61 32.51,67.06 32,66.55 24.77,66.55 24.51,66.29 USART2.2
PB16: length 61.6
  Top Layer w0.254: H3.7 68.83,68.07 69.12,67.78 69.12,61.05 MSPM0G3507.7
  Bottom Layer w0.254: H3.7 67.36,67.49 66.85,67.49 66.68,67.31 66.68,63.5 66.42,63.25 22.22,63.25 21.97,63.5 USART2.1
PB22: length 10
  Top Layer w0.254: H1.8 51.82,13.08 51.4,13.5 51.4,16.49 52.58,17.67 52.58,21.56 MSPM0G3507.73
RST: length 9.2
  Top Layer w0.254: MSPM0G3507.58 39.99,24.14 41.15,22.99 41.15,17.27 H2.3
SERVO1: length 3.6
  Top Layer w0.254: 舵机1.1 11.94,41.53 舵机控制端口.4
SERVO2: length 3.4
  Top Layer w0.254: 舵机控制端口.3 12.23,44.37 舵机2.1
SERVO3: length 3.3
  Top Layer w0.254: 舵机3.1 12.53,47.2 舵机控制端口.2
SERVO4: length 3.4
  Top Layer w0.254: 舵机控制端口.1 12.32,50.04 舵机4.1
$1N12722: length 19.9
  Top Layer w0.889: 74.42,93.98 77.34,93.98 78.49,92.84 78.49,85.34 78.92,84.91 86.17,84.91
$1N16587: length 4.1
  Top Layer w0.254: R7.2 66.93,1.52 66.8,1.65
$1N16619: length 4.6
  Top Layer w0.254: R11.2 77.6,1.65 LED2.2

## Copper pours and planes (outline as drawn; the poured copper is in the pictures)
GND on Top Layer: -14.35,108.71 116.46,108.71 116.46,-18.16 -14.35,-18.16
GND on Bottom Layer: -25.27,112.14 159.64,112.14 159.64,-21.21 -25.27,-21.21

Small or netless copper shapes (teardrops, artwork), in the pictures only: 10 on Top Layer, 4 on Bottom Layer

## Text on the board
Top Silkscreen Layer: 3.3V | BEEP | GND | 500-1000Ω都可以 | 编码器采用中断控制 | 版权所有 侵权必究 | 注意OLED引脚顺序 | 电赛专用
